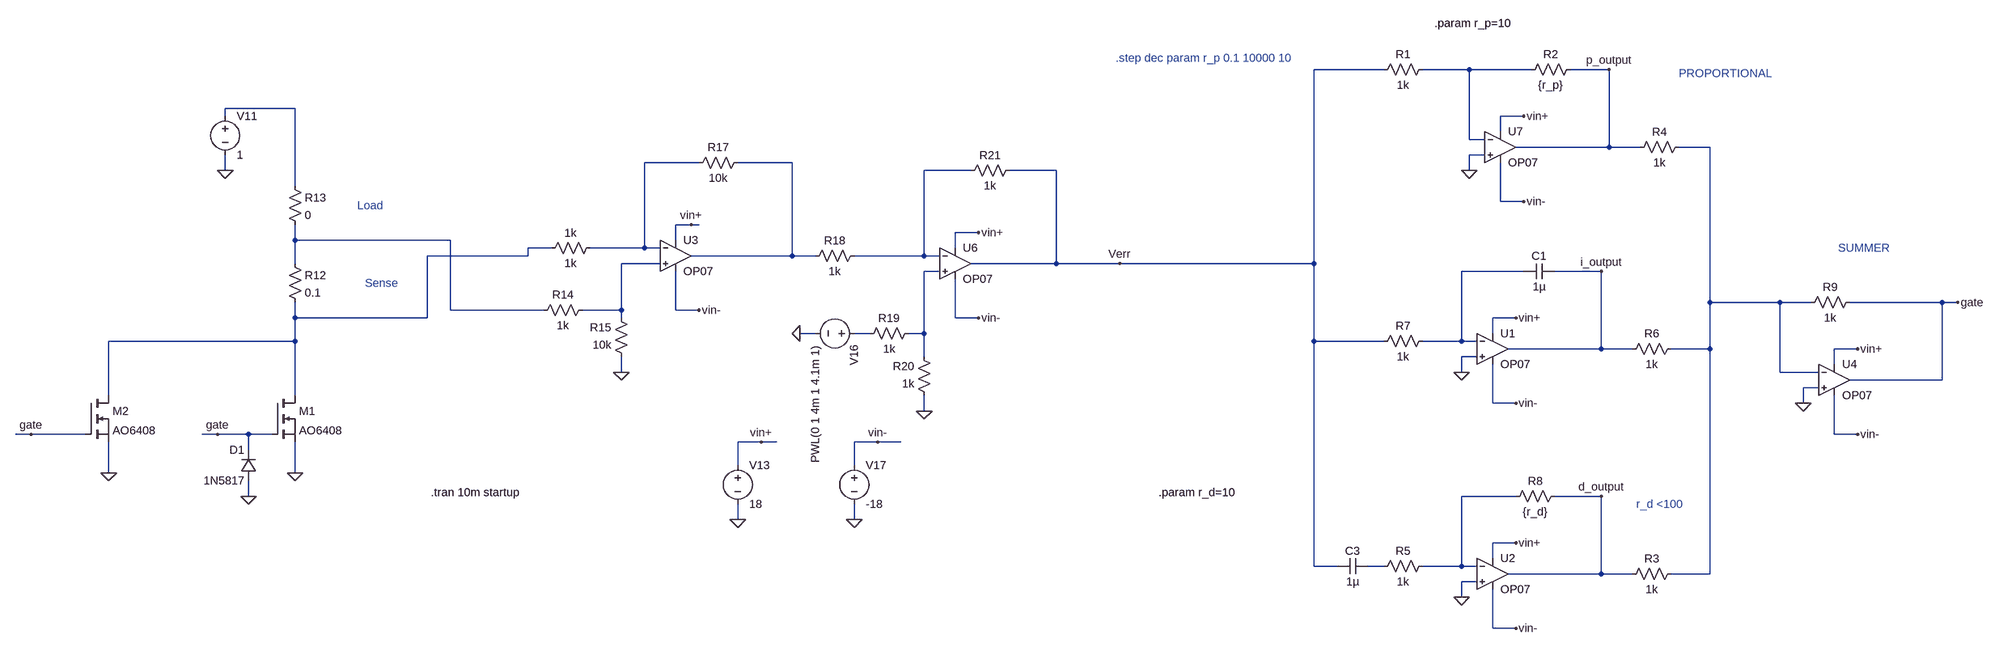
[diagram p0: schematic Programmable_Current_Load.asc]
Programmable_Current_Load.asc, the LTspice schematic file:
Version 4.1
SHEET 1 6516 680
WIRE 4320 -4000 4176 -4000
WIRE 4496 -4000 4400 -4000
WIRE 4624 -4000 4496 -4000
WIRE 4784 -4000 4704 -4000
WIRE 1872 -3920 1728 -3920
WIRE 1728 -3904 1728 -3920
WIRE 4608 -3904 4560 -3904
WIRE 4560 -3872 4560 -3904
WIRE 4496 -3856 4496 -4000
WIRE 4528 -3856 4496 -3856
WIRE 4784 -3840 4784 -4000
WIRE 4784 -3840 4592 -3840
WIRE 4848 -3840 4784 -3840
WIRE 4992 -3840 4928 -3840
WIRE 4528 -3824 4496 -3824
WIRE 2704 -3808 2592 -3808
WIRE 2896 -3808 2784 -3808
WIRE 1728 -3792 1728 -3824
WIRE 3264 -3792 3168 -3792
WIRE 3440 -3792 3344 -3792
WIRE 4496 -3792 4496 -3824
WIRE 1872 -3760 1872 -3920
WIRE 4560 -3728 4560 -3808
WIRE 4608 -3728 4560 -3728
WIRE 2688 -3680 2656 -3680
WIRE 2704 -3680 2688 -3680
WIRE 3280 -3664 3232 -3664
WIRE 1872 -3648 1872 -3680
WIRE 2192 -3648 1872 -3648
WIRE 2656 -3648 2656 -3680
WIRE 2400 -3632 2352 -3632
WIRE 2592 -3632 2592 -3808
WIRE 2592 -3632 2480 -3632
WIRE 2624 -3632 2592 -3632
WIRE 3232 -3632 3232 -3664
WIRE 2352 -3616 2352 -3632
WIRE 2352 -3616 2144 -3616
WIRE 2896 -3616 2896 -3808
WIRE 2896 -3616 2688 -3616
WIRE 2944 -3616 2896 -3616
WIRE 3168 -3616 3168 -3792
WIRE 3168 -3616 3024 -3616
WIRE 3200 -3616 3168 -3616
WIRE 1872 -3600 1872 -3648
WIRE 2624 -3600 2544 -3600
WIRE 3440 -3600 3440 -3792
WIRE 3440 -3600 3264 -3600
WIRE 3776 -3600 3440 -3600
WIRE 4176 -3600 4176 -4000
WIRE 4176 -3600 3776 -3600
WIRE 3200 -3584 3168 -3584
WIRE 4608 -3584 4480 -3584
WIRE 4768 -3584 4672 -3584
WIRE 4992 -3520 4992 -3840
WIRE 5136 -3520 4992 -3520
WIRE 5200 -3520 5136 -3520
WIRE 5472 -3520 5280 -3520
WIRE 5504 -3520 5472 -3520
WIRE 2192 -3504 2192 -3648
WIRE 2384 -3504 2192 -3504
WIRE 2544 -3504 2544 -3600
WIRE 2544 -3504 2464 -3504
WIRE 2656 -3504 2656 -3584
WIRE 2704 -3504 2656 -3504
WIRE 1872 -3488 1872 -3520
WIRE 2144 -3488 2144 -3616
WIRE 2144 -3488 1872 -3488
WIRE 2544 -3488 2544 -3504
WIRE 3232 -3488 3232 -3568
WIRE 3280 -3488 3232 -3488
WIRE 4592 -3488 4544 -3488
WIRE 2944 -3456 2912 -3456
WIRE 3056 -3456 3024 -3456
WIRE 3168 -3456 3168 -3584
WIRE 3168 -3456 3136 -3456
WIRE 4544 -3456 4544 -3488
WIRE 1872 -3440 1872 -3488
WIRE 1872 -3440 1488 -3440
WIRE 4176 -3440 4176 -3600
WIRE 4320 -3440 4176 -3440
WIRE 4480 -3440 4480 -3584
WIRE 4480 -3440 4400 -3440
WIRE 4512 -3440 4480 -3440
WIRE 4768 -3424 4768 -3584
WIRE 4768 -3424 4576 -3424
WIRE 4832 -3424 4768 -3424
WIRE 4992 -3424 4992 -3520
WIRE 4992 -3424 4912 -3424
WIRE 5296 -3424 5248 -3424
WIRE 3168 -3408 3168 -3456
WIRE 4512 -3408 4480 -3408
WIRE 5248 -3392 5248 -3424
WIRE 2544 -3376 2544 -3408
WIRE 4480 -3376 4480 -3408
WIRE 5136 -3376 5136 -3520
WIRE 5216 -3376 5136 -3376
WIRE 5472 -3360 5472 -3520
WIRE 5472 -3360 5280 -3360
WIRE 5216 -3344 5184 -3344
WIRE 1488 -3328 1488 -3440
WIRE 1872 -3328 1872 -3440
WIRE 4544 -3312 4544 -3392
WIRE 4592 -3312 4544 -3312
WIRE 5184 -3312 5184 -3344
WIRE 3168 -3296 3168 -3328
WIRE 1328 -3248 1296 -3248
WIRE 1440 -3248 1328 -3248
WIRE 1712 -3248 1680 -3248
WIRE 1776 -3248 1712 -3248
WIRE 1824 -3248 1776 -3248
WIRE 5248 -3248 5248 -3328
WIRE 5296 -3248 5248 -3248
WIRE 2832 -3232 2784 -3232
WIRE 2864 -3232 2832 -3232
WIRE 3072 -3232 3024 -3232
WIRE 3120 -3232 3072 -3232
WIRE 1776 -3216 1776 -3248
WIRE 2784 -3184 2784 -3232
WIRE 3024 -3184 3024 -3232
WIRE 1488 -3168 1488 -3232
WIRE 1872 -3168 1872 -3232
WIRE 1776 -3120 1776 -3152
WIRE 4592 -3120 4480 -3120
WIRE 4768 -3120 4672 -3120
WIRE 2784 -3072 2784 -3104
WIRE 3024 -3072 3024 -3104
WIRE 4592 -3024 4544 -3024
WIRE 4544 -2992 4544 -3024
WIRE 4176 -2976 4176 -3440
WIRE 4224 -2976 4176 -2976
WIRE 4320 -2976 4288 -2976
WIRE 4480 -2976 4480 -3120
WIRE 4480 -2976 4400 -2976
WIRE 4512 -2976 4480 -2976
WIRE 4768 -2960 4768 -3120
WIRE 4768 -2960 4576 -2960
WIRE 4832 -2960 4768 -2960
WIRE 4992 -2960 4992 -3424
WIRE 4992 -2960 4912 -2960
WIRE 4512 -2944 4480 -2944
WIRE 4480 -2912 4480 -2944
WIRE 4544 -2848 4544 -2928
WIRE 4592 -2848 4544 -2848
FLAG 4496 -3792 0
FLAG 3776 -3600 Verr
FLAG 5184 -3312 0
FLAG 5504 -3520 gate
FLAG 1712 -3248 gate
FLAG 1776 -3120 0
FLAG 1872 -3168 0
FLAG 1728 -3792 0
FLAG 2544 -3376 0
FLAG 2912 -3456 0
FLAG 3168 -3296 0
FLAG 4784 -4000 p_output
FLAG 4480 -3376 0
FLAG 4768 -3584 i_output
FLAG 4480 -2912 0
FLAG 4768 -3120 d_output
FLAG 2784 -3072 0
FLAG 3024 -3072 0
FLAG 2832 -3232 vin+
FLAG 3072 -3232 vin-
FLAG 2688 -3680 vin+
FLAG 3280 -3664 vin+
FLAG 4608 -3904 vin+
FLAG 4592 -3488 vin+
FLAG 4592 -3024 vin+
FLAG 5296 -3424 vin+
FLAG 2704 -3504 vin-
FLAG 3280 -3488 vin-
FLAG 4592 -2848 vin-
FLAG 4592 -3312 vin-
FLAG 4608 -3728 vin-
FLAG 5296 -3248 vin-
FLAG 1488 -3168 0
FLAG 1328 -3248 gate
SYMBOL res 4416 -4016 R90
WINDOW 0 0 56 VBottom 2
WINDOW 3 32 56 VTop 2
SYMATTR InstName R1
SYMATTR Value 1k
SYMBOL res 4720 -4016 R90
WINDOW 0 0 56 VBottom 2
WINDOW 3 32 56 VTop 2
SYMATTR InstName R2
SYMATTR Value {r_p}
SYMBOL res 5296 -3536 R90
WINDOW 0 0 56 VBottom 2
WINDOW 3 32 56 VTop 2
SYMATTR InstName R9
SYMATTR Value 1k
SYMBOL nmos 1824 -3328 R0
SYMATTR InstName M1
SYMATTR Value AO6408
SYMBOL diode 1792 -3152 R180
WINDOW 0 24 64 Left 2
WINDOW 3 24 0 Left 2
SYMATTR InstName D1
SYMATTR Value 1N5817
SYMBOL res 1856 -3616 R0
SYMATTR InstName R12
SYMATTR Value 0.1
SYMBOL res 1856 -3776 R0
SYMATTR InstName R13
SYMATTR Value 0
SYMBOL voltage 1728 -3920 R0
WINDOW 123 0 0 Left 0
WINDOW 39 0 0 Left 0
SYMATTR InstName V11
SYMATTR Value 1
SYMBOL res 2480 -3520 R90
WINDOW 0 0 56 VBottom 2
WINDOW 3 32 56 VTop 2
SYMATTR InstName R14
SYMATTR Value 1k
SYMBOL res 2560 -3392 R180
WINDOW 0 36 76 Left 2
WINDOW 3 36 40 Left 2
SYMATTR InstName R15
SYMATTR Value 10k
SYMBOL res 2496 -3648 R90
WINDOW 0 0 56 VBottom 2
WINDOW 3 32 56 VTop 2
SYMATTR InstName 1k
SYMATTR Value 1k
SYMBOL res 2800 -3824 R90
WINDOW 0 0 56 VBottom 2
WINDOW 3 32 56 VTop 2
SYMATTR InstName R17
SYMATTR Value 10k
SYMBOL voltage 3040 -3456 R90
WINDOW 123 0 0 Left 0
WINDOW 39 0 0 Left 0
SYMATTR InstName V16
SYMATTR Value PWL(0 1 4m 1 4.1m 1)
SYMBOL res 3040 -3632 R90
WINDOW 0 0 56 VBottom 2
WINDOW 3 32 56 VTop 2
SYMATTR InstName R18
SYMATTR Value 1k
SYMBOL res 3152 -3472 R90
WINDOW 0 0 56 VBottom 2
WINDOW 3 32 56 VTop 2
SYMATTR InstName R19
SYMATTR Value 1k
SYMBOL res 3184 -3312 R180
WINDOW 0 36 76 Left 2
WINDOW 3 36 40 Left 2
SYMATTR InstName R20
SYMATTR Value 1k
SYMBOL res 3360 -3808 R90
WINDOW 0 0 56 VBottom 2
WINDOW 3 32 56 VTop 2
SYMATTR InstName R21
SYMATTR Value 1k
SYMBOL res 4944 -3856 R90
WINDOW 0 0 56 VBottom 2
WINDOW 3 32 56 VTop 2
SYMATTR InstName R4
SYMATTR Value 1k
SYMBOL res 4928 -3440 R90
WINDOW 0 0 56 VBottom 2
WINDOW 3 32 56 VTop 2
SYMATTR InstName R6
SYMATTR Value 1k
SYMBOL res 4416 -3456 R90
WINDOW 0 0 56 VBottom 2
WINDOW 3 32 56 VTop 2
SYMATTR InstName R7
SYMATTR Value 1k
SYMBOL cap 4672 -3600 R90
WINDOW 0 0 32 VBottom 2
WINDOW 3 32 32 VTop 2
SYMATTR InstName C1
SYMATTR Value 1µ
SYMBOL res 4928 -2976 R90
WINDOW 0 0 56 VBottom 2
WINDOW 3 32 56 VTop 2
SYMATTR InstName R3
SYMATTR Value 1k
SYMBOL res 4416 -2992 R90
WINDOW 0 0 56 VBottom 2
WINDOW 3 32 56 VTop 2
SYMATTR InstName R5
SYMATTR Value 1k
SYMBOL cap 4288 -2992 R90
WINDOW 0 0 32 VBottom 2
WINDOW 3 32 32 VTop 2
SYMATTR InstName C3
SYMATTR Value 1µ
SYMBOL res 4688 -3136 R90
WINDOW 0 0 56 VBottom 2
WINDOW 3 32 56 VTop 2
SYMATTR InstName R8
SYMATTR Value {r_d}
SYMBOL voltage 2784 -3200 R0
WINDOW 123 0 0 Left 0
WINDOW 39 0 0 Left 0
SYMATTR InstName V13
SYMATTR Value 18
SYMBOL voltage 3024 -3200 R0
WINDOW 123 0 0 Left 0
WINDOW 39 0 0 Left 0
SYMATTR InstName V17
SYMATTR Value -18
SYMBOL nmos 1440 -3328 R0
SYMATTR InstName M2
SYMATTR Value AO6408
SYMBOL OpAmps\\OP07 2656 -3680 R0
SYMATTR InstName U3
SYMBOL OpAmps\\OP07 3232 -3664 R0
SYMATTR InstName U6
SYMBOL OpAmps\\OP07 4560 -3904 R0
SYMATTR InstName U7
SYMBOL OpAmps\\OP07 4544 -3488 R0
SYMATTR InstName U1
SYMBOL OpAmps\\OP07 4544 -3024 R0
SYMATTR InstName U2
SYMBOL OpAmps\\OP07 5248 -3424 R0
SYMATTR InstName U4
TEXT 3856 -3128 Left 2 !.param r_d=10
TEXT 5256 -3632 Left 2 ;SUMMER
TEXT 4928 -3992 Left 2 ;PROPORTIONAL
TEXT 2000 -3720 Left 2 ;Load
TEXT 2016 -3560 Left 2 ;Sense
TEXT 2152 -3128 Left 2 !.tran 10m startup
TEXT 3768 -4024 Left 2 ;.step dec param r_p 0.1 10000 10
TEXT 4840 -3104 Left 2 ;r_d <100
TEXT 4424 -4096 Left 2 !.param r_p=10

The netlist it stands for:
* Programmable_Current_Load.asc
R1 N001 Verr 1k
R2 p_output N001 {r_p}
R9 gate N003 1k
M1 N008 gate 0 0 AO6408
D1 0 gate 1N5817
R12 N007 N008 0.1
R13 N002 N007 0
V11 N002 0 1
R14 N009 N007 1k
R15 0 N009 10k
R§1k N004 N008 1k
R17 N005 N004 10k
V16 N012 0 PWL(0 1 4m 1 4.1m 1)
R18 N006 N005 1k
R19 N010 N012 1k
R20 0 N010 1k
R21 Verr N006 1k
R4 N003 p_output 1k
R6 N003 i_output 1k
R7 N011 Verr 1k
C1 i_output N011 1µ
R3 N003 d_output 1k
R5 N013 N014 1k
C3 N014 Verr 1µ
R8 d_output N013 {r_d}
V13 vin+ 0 18
V17 vin- 0 -18
M2 N008 gate 0 0 AO6408
X§U3 N009 N004 vin+ vin- N005 LT1001  ; OP07, pins In+ In- V+ V- OUT
X§U6 N010 N006 vin+ vin- Verr LT1001  ; OP07, pins In+ In- V+ V- OUT
X§U7 0 N001 vin+ vin- p_output LT1001  ; OP07, pins In+ In- V+ V- OUT
X§U1 0 N011 vin+ vin- i_output LT1001  ; OP07, pins In+ In- V+ V- OUT
X§U2 0 N013 vin+ vin- d_output LT1001  ; OP07, pins In+ In- V+ V- OUT
X§U4 0 N003 vin+ vin- gate LT1001  ; OP07, pins In+ In- V+ V- OUT
.model D D
.lib standard.dio
.model NMOS NMOS
.model PMOS PMOS
.lib standard.mos
.param r_d=10
* SUMMER
* PROPORTIONAL
* Load
* Sense
.tran 10m startup
* .step dec param r_p 0.1 10000 10
* r_d <100
.param r_p=10
.lib LTC.lib
.backanno
.end